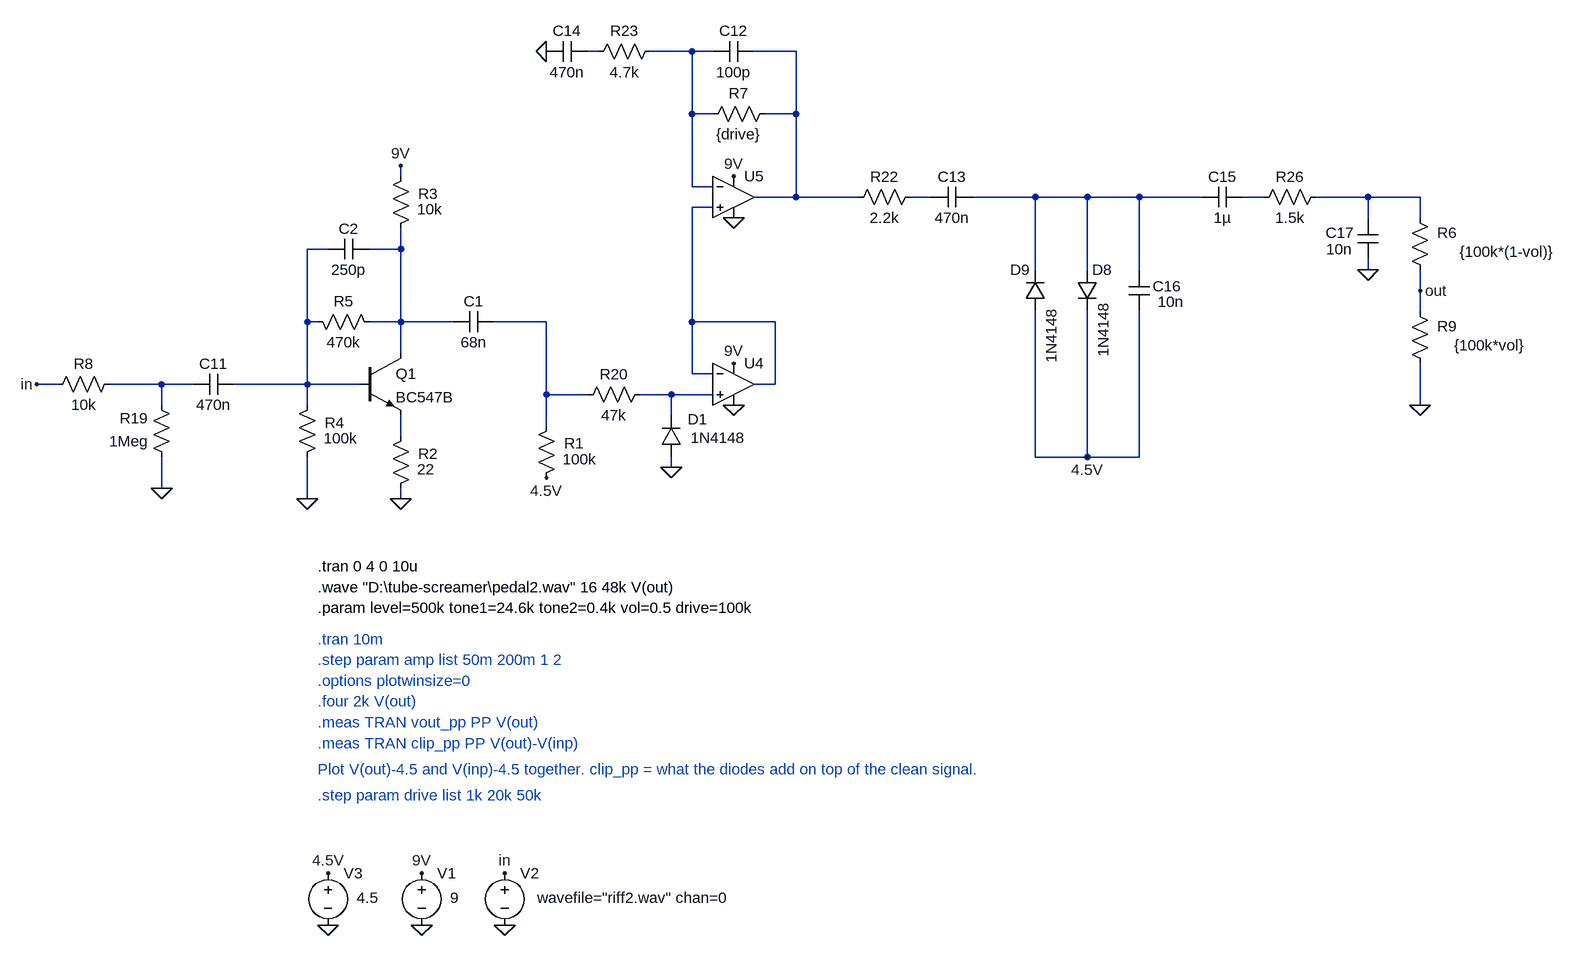
[diagram p0: schematic Hard Clipper.asc]
Hard Clipper.asc, the LTspice schematic file:
Version 4.1
SHEET 1 3404 1296
WIRE 96 -1872 80 -1872
WIRE 240 -1872 176 -1872
WIRE 272 -1872 240 -1872
WIRE 400 -1872 336 -1872
WIRE 240 -1776 240 -1872
WIRE 272 -1776 240 -1776
WIRE 400 -1776 400 -1872
WIRE 400 -1776 352 -1776
WIRE -208 -1680 -208 -1696
WIRE 240 -1664 240 -1776
WIRE 272 -1664 240 -1664
WIRE 400 -1648 400 -1776
WIRE 400 -1648 336 -1648
WIRE 496 -1648 400 -1648
WIRE 608 -1648 576 -1648
WIRE 768 -1648 672 -1648
WIRE 848 -1648 768 -1648
WIRE 928 -1648 848 -1648
WIRE 1024 -1648 928 -1648
WIRE 1120 -1648 1088 -1648
WIRE 1280 -1648 1200 -1648
WIRE 1360 -1648 1280 -1648
WIRE 272 -1632 240 -1632
WIRE 1280 -1616 1280 -1648
WIRE 1360 -1616 1360 -1648
WIRE -320 -1568 -352 -1568
WIRE -208 -1568 -208 -1600
WIRE -208 -1568 -256 -1568
WIRE 768 -1536 768 -1648
WIRE 848 -1536 848 -1648
WIRE 928 -1536 928 -1648
WIRE 1280 -1536 1280 -1552
WIRE 1360 -1504 1360 -1536
WIRE 1360 -1472 1360 -1504
WIRE -352 -1456 -352 -1568
WIRE -336 -1456 -352 -1456
WIRE -208 -1456 -208 -1568
WIRE -208 -1456 -256 -1456
WIRE -128 -1456 -208 -1456
WIRE 16 -1456 -64 -1456
WIRE 240 -1456 240 -1632
WIRE 368 -1456 240 -1456
WIRE -208 -1408 -208 -1456
WIRE 240 -1376 240 -1456
WIRE 272 -1376 240 -1376
WIRE -736 -1360 -768 -1360
WIRE -576 -1360 -656 -1360
WIRE -528 -1360 -576 -1360
WIRE -352 -1360 -352 -1456
WIRE -352 -1360 -464 -1360
WIRE -272 -1360 -352 -1360
WIRE 368 -1360 368 -1456
WIRE 368 -1360 336 -1360
WIRE 16 -1344 16 -1456
WIRE 80 -1344 16 -1344
WIRE 208 -1344 160 -1344
WIRE 272 -1344 208 -1344
WIRE -576 -1328 -576 -1360
WIRE -352 -1328 -352 -1360
WIRE 1360 -1328 1360 -1392
WIRE 208 -1312 208 -1344
WIRE 16 -1296 16 -1344
WIRE -208 -1280 -208 -1312
WIRE 768 -1248 768 -1472
WIRE 848 -1248 848 -1472
WIRE 848 -1248 768 -1248
WIRE 928 -1248 928 -1472
WIRE 928 -1248 848 -1248
WIRE 208 -1232 208 -1248
WIRE -576 -1200 -576 -1248
WIRE -352 -1184 -352 -1248
WIRE -208 -1184 -208 -1200
FLAG -48 -528 0
FLAG -176 -528 0
FLAG -176 -608 9V
FLAG -320 -528 0
FLAG -320 -608 4.5V
FLAG 1360 -1328 0
FLAG 1360 -1504 out
FLAG -48 -608 in
FLAG -768 -1360 in
FLAG -576 -1200 0
FLAG 304 -1328 0
FLAG 304 -1392 9V
FLAG 16 -1216 4.5V
FLAG 304 -1616 0
FLAG 304 -1680 9V
FLAG 1280 -1536 0
FLAG 16 -1872 0
FLAG -208 -1184 0
FLAG -208 -1696 9V
FLAG -352 -1184 0
FLAG 848 -1248 4.5V
FLAG 208 -1232 0
SYMBOL voltage -176 -624 R0
WINDOW 3 44 54 Left 2
WINDOW 123 0 0 Left 0
WINDOW 39 0 0 Left 0
SYMATTR Value 9
SYMATTR InstName V1
SYMBOL voltage -48 -624 R0
WINDOW 123 0 0 Left 0
WINDOW 39 0 0 Left 0
WINDOW 3 50 54 Left 2
SYMATTR Value wavefile="riff2.wav" chan=0
SYMATTR InstName V2
SYMBOL voltage -320 -624 R0
WINDOW 3 44 54 Left 2
WINDOW 123 0 0 Left 0
WINDOW 39 0 0 Left 0
SYMATTR Value 4.5
SYMATTR InstName V3
SYMBOL res 1376 -1520 R180
WINDOW 0 -41 73 Left 2
WINDOW 3 -192 44 Left 2
SYMATTR InstName R6
SYMATTR Value {100k*(1-vol)}
SYMBOL res -560 -1232 R180
WINDOW 0 36 76 Left 2
WINDOW 3 36 40 Left 2
SYMATTR InstName R19
SYMATTR Value 1Meg
SYMBOL res 176 -1360 R90
WINDOW 0 0 56 VBottom 2
WINDOW 3 32 56 VTop 2
SYMATTR InstName R20
SYMATTR Value 47k
SYMBOL cap -464 -1376 R90
WINDOW 0 0 32 VBottom 2
WINDOW 3 32 32 VTop 2
SYMATTR InstName C11
SYMATTR Value 470n
SYMBOL OpAmps\\UniversalOpAmp2 304 -1360 R0
SYMATTR InstName U4
SYMATTR Value2 Avol=1Meg GBW=3Meg Slew=10Meg
SYMBOL cap 272 -1856 R270
WINDOW 0 32 32 VTop 2
WINDOW 3 0 32 VBottom 2
SYMATTR InstName C12
SYMATTR Value 100p
SYMBOL cap 672 -1664 R90
WINDOW 0 0 32 VBottom 2
WINDOW 3 32 32 VTop 2
SYMATTR InstName C13
SYMATTR Value 470n
SYMBOL res 592 -1664 R90
WINDOW 0 0 56 VBottom 2
WINDOW 3 32 56 VTop 2
SYMATTR InstName R22
SYMATTR Value 2.2k
SYMBOL OpAmps\\UniversalOpAmp2 304 -1648 R0
SYMATTR InstName U5
SYMATTR Value2 Avol=1Meg GBW=3Meg Slew=10Meg
SYMBOL res 80 -1856 R270
WINDOW 0 32 56 VTop 2
WINDOW 3 0 56 VBottom 2
SYMATTR InstName R23
SYMATTR Value 4.7k
SYMBOL cap 16 -1856 R270
WINDOW 0 32 32 VTop 2
WINDOW 3 0 32 VBottom 2
SYMATTR InstName C14
SYMATTR Value 470n
SYMBOL cap 1088 -1664 R90
WINDOW 0 0 32 VBottom 2
WINDOW 3 32 32 VTop 2
SYMATTR InstName C15
SYMATTR Value 1µ
SYMBOL cap 944 -1472 R180
WINDOW 0 -49 39 Left 2
WINDOW 3 -53 15 Left 2
SYMATTR InstName C16
SYMATTR Value 10n
SYMBOL diode 832 -1536 R0
WINDOW 3 41 49 VRight 2
SYMATTR InstName D8
SYMATTR Value 1N4148
SYMBOL diode 784 -1472 R180
WINDOW 0 24 64 Left 2
WINDOW 3 -9 -79 VRight 2
SYMATTR InstName D9
SYMATTR Value 1N4148
SYMBOL res 1216 -1664 R90
WINDOW 0 0 56 VBottom 2
WINDOW 3 32 56 VTop 2
SYMATTR InstName R26
SYMATTR Value 1.5k
SYMBOL cap 1296 -1552 R180
WINDOW 0 37 41 Left 2
WINDOW 3 40 16 Left 2
SYMATTR InstName C17
SYMATTR Value 10n
SYMBOL res 0 -1200 M180
WINDOW 0 43 69 Left 2
WINDOW 3 41 45 Left 2
SYMATTR InstName R1
SYMATTR Value 100k
SYMBOL npn3 -272 -1408 R0
SYMATTR InstName Q1
SYMATTR Value BC547B
SYMBOL res -224 -1184 M180
WINDOW 0 43 69 Left 2
WINDOW 3 41 45 Left 2
SYMATTR InstName R2
SYMATTR Value 22
SYMBOL cap -128 -1440 R270
WINDOW 0 32 32 VTop 2
WINDOW 3 0 32 VBottom 2
SYMATTR InstName C1
SYMATTR Value 68n
SYMBOL res -224 -1584 M180
WINDOW 0 43 69 Left 2
WINDOW 3 41 45 Left 2
SYMATTR InstName R3
SYMATTR Value 10k
SYMBOL res -368 -1232 M180
WINDOW 0 43 69 Left 2
WINDOW 3 41 45 Left 2
SYMATTR InstName R4
SYMATTR Value 100k
SYMBOL res -352 -1472 M90
WINDOW 0 0 56 VBottom 2
WINDOW 3 32 56 VTop 2
SYMATTR InstName R5
SYMATTR Value 470k
SYMBOL cap -320 -1552 R270
WINDOW 0 32 32 VTop 2
WINDOW 3 0 32 VBottom 2
SYMATTR InstName C2
SYMATTR Value 250p
SYMBOL diode 224 -1248 R180
WINDOW 0 -40 58 Left 2
WINDOW 3 -99 30 Left 2
SYMATTR InstName D1
SYMATTR Value 1N4148
SYMBOL res 256 -1760 R270
WINDOW 0 32 56 VTop 2
WINDOW 3 0 56 VBottom 2
SYMATTR InstName R7
SYMATTR Value {drive}
SYMBOL res -752 -1344 R270
WINDOW 0 32 56 VTop 2
WINDOW 3 0 56 VBottom 2
SYMATTR InstName R8
SYMATTR Value 10k
SYMBOL res 1376 -1376 R180
WINDOW 0 -41 73 Left 2
WINDOW 3 -145 44 Left 2
SYMATTR InstName R9
SYMATTR Value {100k*vol}
TEXT -336 -968 Left 2 ;.tran 10m
TEXT -336 -936 Left 2 ;.step param amp list 50m 200m 1 2
TEXT -336 -904 Left 2 ;.options plotwinsize=0
TEXT -336 -872 Left 2 ;.four 2k V(out)
TEXT -336 -840 Left 2 ;.meas TRAN vout_pp PP V(out)
TEXT -336 -808 Left 2 ;.meas TRAN clip_pp PP V(out)-V(inp)
TEXT -336 -768 Left 2 ;Plot V(out)-4.5 and V(inp)-4.5 together. clip_pp = what the diodes add on top of the clean signal.
TEXT -336 -728 Left 2 ;.step param drive list 1k 20k 50k
TEXT -336 -1080 Left 2 !.tran 0 4 0 10u
TEXT -336 -1048 Left 2 !.wave "D:\\tube-screamer\\pedal2.wav" 16 48k V(out)
TEXT -336 -1016 Left 2 !.param level=500k tone1=24.6k tone2=0.4k vol=0.5 drive=100k

The netlist it stands for:
* Hard Clipper.asc
V1 9V 0 9
V2 in 0 wavefile="riff2.wav" chan=0
V3 4.5V 0 4.5
R6 out N007 {100k*(1-vol)}
R19 0 N012 1Meg
R20 N013 N011 47k
C11 N009 N012 470n
X§U4 N013 N008 9V 0 N008 level2 Avol=1Meg GBW=3Meg Slew=10Meg Ilimit=25m Rail=0 Vos=0 En=0 Enk=0 In=0 Ink=0 Rin=500Meg  ; pins In+ In- V+ V- OUT
C12 N002 N003 100p
C13 N005 N004 470n
R22 N004 N003 2.2k
X§U5 N008 N002 9V 0 N003 level2 Avol=1Meg GBW=3Meg Slew=10Meg Ilimit=25m Rail=0 Vos=0 En=0 Enk=0 In=0 Ink=0 Rin=500Meg  ; pins In+ In- V+ V- OUT
R23 N001 N002 4.7k
C14 0 N001 470n
C15 N006 N005 1µ
C16 4.5V N005 10n
D8 N005 4.5V 1N4148
D9 4.5V N005 1N4148
R26 N007 N006 1.5k
C17 0 N007 10n
R1 4.5V N011 100k
Q1 N010 N009 N014 0 BC547B
R2 0 N014 22
C1 N010 N011 68n
R3 N010 9V 10k
R4 0 N009 100k
R5 N009 N010 470k
C2 N009 N010 250p
D1 0 N013 1N4148
R7 N002 N003 {drive}
R8 in N012 10k
R9 0 out {100k*vol}
.model D D
.lib standard.dio
.model NPN NPN
.model PNP PNP
.lib standard.bjt
* .tran 10m
* .step param amp list 50m 200m 1 2
* .options plotwinsize=0
* .four 2k V(out)
* .meas TRAN vout_pp PP V(out)
* .meas TRAN clip_pp PP V(out)-V(inp)
* Plot V(out)-4.5 and V(inp)-4.5 together. clip_pp = what the diodes add on top of the clean signal.
* .step param drive list 1k 20k 50k
.tran 0 4 0 10u
.wave "D:\tube-screamer\pedal2.wav" 16 48k V(out)
.param level=500k tone1=24.6k tone2=0.4k vol=0.5 drive=100k
.lib UniversalOpAmp2.lib
.backanno
.end